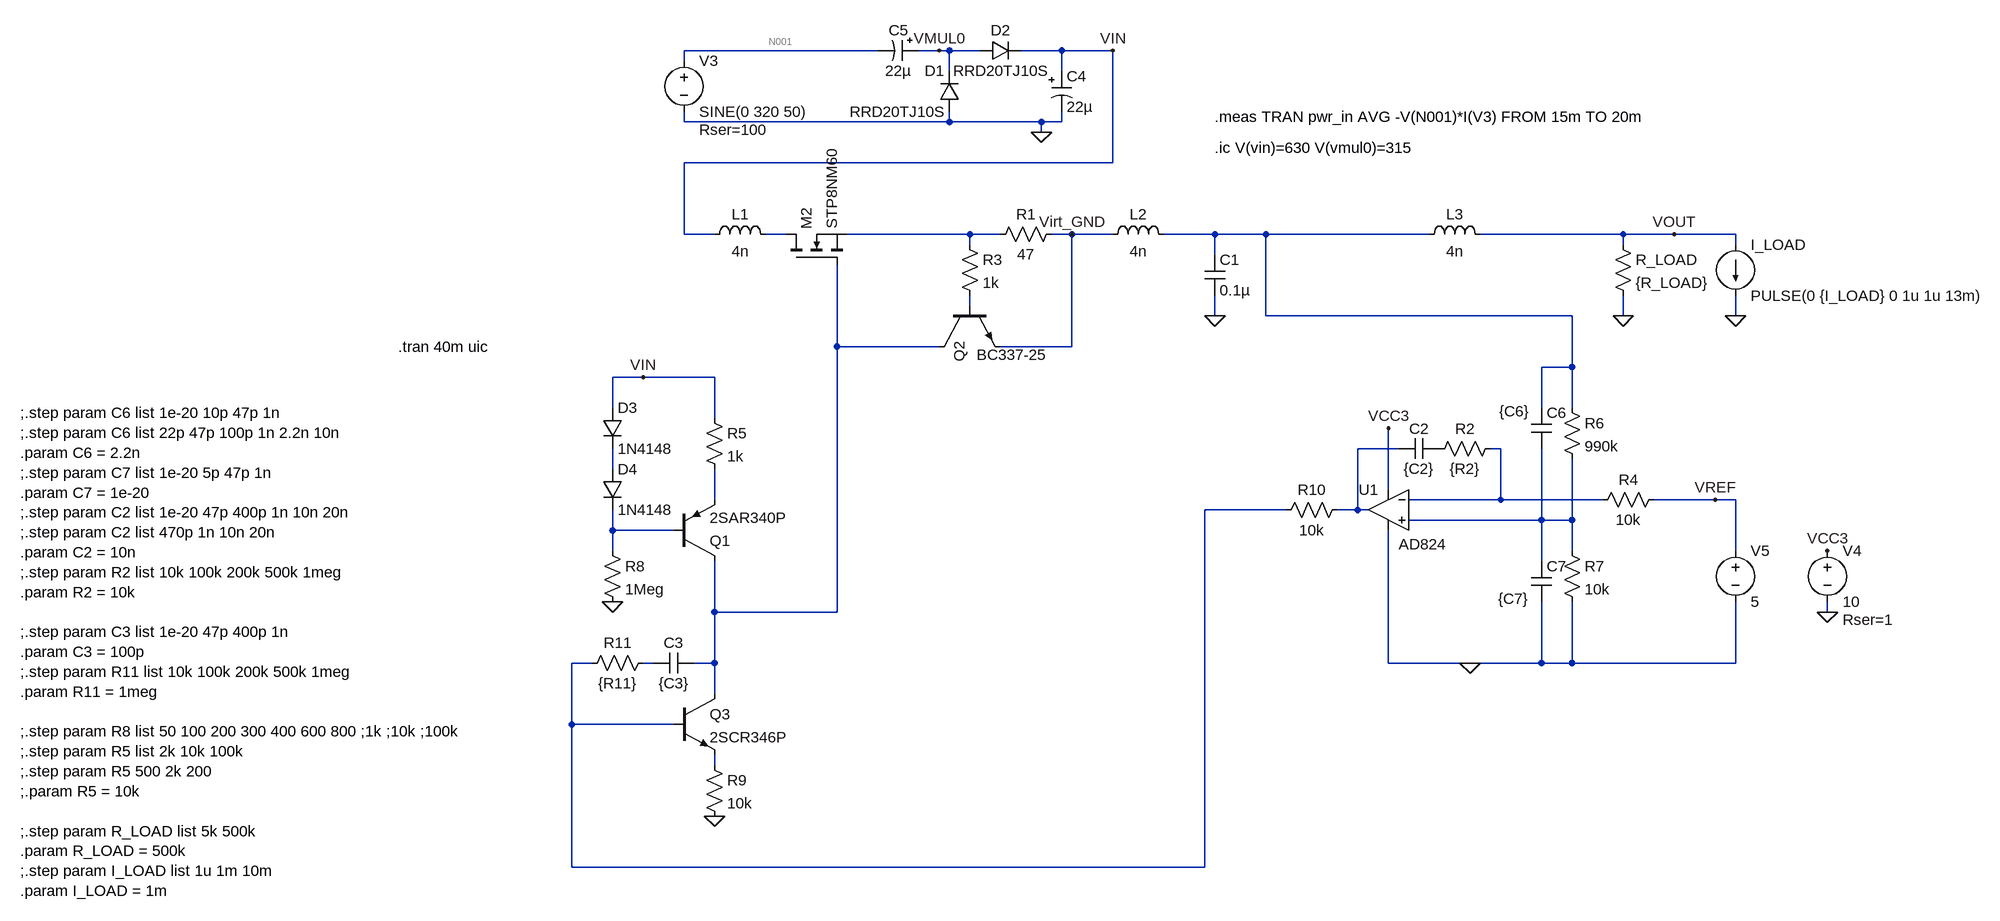
[diagram p0: schematic high_voltage_power_supply_Tim2.asc]
high_voltage_power_supply_Tim2.asc, the LTspice schematic file:
Version 4
SHEET 1 2392 1152
WIRE 464 -288 160 -288
WIRE 560 -288 528 -288
WIRE 576 -288 560 -288
WIRE 624 -288 576 -288
WIRE 752 -288 688 -288
WIRE 832 -288 752 -288
WIRE 160 -272 160 -288
WIRE 576 -256 576 -288
WIRE 752 -256 752 -288
WIRE 160 -176 160 -192
WIRE 576 -176 576 -192
WIRE 576 -176 160 -176
WIRE 720 -176 576 -176
WIRE 752 -176 752 -192
WIRE 752 -176 720 -176
WIRE 720 -160 720 -176
WIRE 832 -112 832 -288
WIRE 832 -112 160 -112
WIRE 160 0 160 -112
WIRE 208 0 160 0
WIRE 320 0 288 0
WIRE 608 0 416 0
WIRE 656 0 608 0
WIRE 768 0 736 0
WIRE 832 0 768 0
WIRE 992 0 912 0
WIRE 1072 0 992 0
WIRE 1328 0 1072 0
WIRE 1632 0 1408 0
WIRE 1712 0 1632 0
WIRE 1808 0 1712 0
WIRE 608 16 608 0
WIRE 1632 16 1632 0
WIRE 1808 16 1808 0
WIRE 992 32 992 0
WIRE 608 112 608 96
WIRE 992 128 992 96
WIRE 1072 128 1072 0
WIRE 1552 128 1072 128
WIRE 1632 128 1632 96
WIRE 1808 128 1808 96
WIRE 400 176 400 48
WIRE 560 176 400 176
WIRE 768 176 768 0
WIRE 768 176 656 176
WIRE 1552 208 1552 128
WIRE 1552 208 1504 208
WIRE 96 224 48 224
WIRE 208 224 96 224
WIRE 48 272 48 224
WIRE 1504 272 1504 208
WIRE 1552 272 1552 208
WIRE 208 288 208 224
WIRE 1280 336 1216 336
WIRE 1440 336 1424 336
WIRE 48 368 48 336
WIRE 1264 400 1264 304
WIRE 208 416 208 368
WIRE 1440 416 1440 336
WIRE 1440 416 1296 416
WIRE 1600 416 1440 416
WIRE 1776 416 1680 416
WIRE 1808 416 1776 416
WIRE 1104 432 976 432
WIRE 1216 432 1216 336
WIRE 1216 432 1184 432
WIRE 1232 432 1216 432
WIRE 1504 448 1504 336
WIRE 1504 448 1296 448
WIRE 1552 448 1552 352
WIRE 1552 448 1504 448
WIRE 48 464 48 432
WIRE 144 464 48 464
WIRE 48 496 48 464
WIRE 1552 496 1552 448
WIRE 1808 496 1808 416
WIRE 1504 512 1504 448
WIRE 208 592 208 512
WIRE 400 592 400 176
WIRE 400 592 208 592
WIRE 1952 592 1952 576
WIRE 16 672 -16 672
WIRE 112 672 96 672
WIRE 208 672 208 592
WIRE 208 672 176 672
WIRE 1264 672 1264 464
WIRE 1392 672 1264 672
WIRE 1504 672 1504 576
WIRE 1504 672 1392 672
WIRE 1552 672 1552 576
WIRE 1552 672 1504 672
WIRE 1808 672 1808 576
WIRE 1808 672 1552 672
WIRE 208 720 208 672
WIRE -16 768 -16 672
WIRE 144 768 -16 768
WIRE 208 832 208 816
WIRE -16 992 -16 768
WIRE 976 992 976 432
WIRE 976 992 -16 992
FLAG 992 128 0
FLAG 1632 128 0
FLAG 1712 0 VOUT
FLAG 1952 592 0
FLAG 1776 416 VREF
FLAG 720 -160 0
FLAG 832 -288 VIN
FLAG 1952 496 VCC3
FLAG 1264 304 VCC3
FLAG 1808 128 0
FLAG 1392 672 0
FLAG 560 -288 VMUL0
FLAG 768 0 Virt_GND
FLAG 96 224 VIN
FLAG 48 576 0
FLAG 208 912 0
SYMBOL npn 560 112 M90
WINDOW 3 77 59 VRight 2
SYMATTR Value BC337-25
SYMATTR InstName Q2
SYMBOL res 640 16 R270
WINDOW 0 32 56 VTop 2
WINDOW 3 0 56 VBottom 2
SYMATTR InstName R1
SYMATTR Value 47
SYMBOL cap 976 32 R0
SYMATTR InstName C1
SYMATTR Value 0.1µ
SYMATTR SpiceLine V=1K Irms=0 Rser=0.0493 Lser=9.64n mfg="Würth Elektronik" pn="890493425009CS WCAP-FTBE 15 x 18 x 15 x 8.5" type="Box"
SYMBOL res 1616 0 R0
SYMATTR InstName R_LOAD
SYMATTR Value {R_LOAD}
SYMBOL voltage 1952 480 R0
WINDOW 123 0 0 Left 0
WINDOW 39 24 124 Left 2
SYMATTR SpiceLine Rser=1
SYMATTR InstName V4
SYMATTR Value 10
SYMBOL res 1536 256 R0
SYMATTR InstName R6
SYMATTR Value 990k
SYMBOL res 1536 480 R0
SYMATTR InstName R7
SYMATTR Value 10k
SYMBOL cap 1344 320 R90
WINDOW 0 0 32 VBottom 2
WINDOW 3 32 32 VTop 2
SYMATTR InstName C2
SYMATTR Value {C2}
SYMATTR SpiceLine V=25 Irms=533m Rser=0.222978 Lser=0
SYMBOL voltage 1808 480 R0
WINDOW 123 0 0 Left 0
WINDOW 39 0 0 Left 0
SYMATTR InstName V5
SYMATTR Value 5
SYMBOL OpAmps\\AD824 1264 368 M0
WINDOW 3 -90 118 Left 2
SYMATTR InstName U1
SYMBOL ind 192 16 R270
WINDOW 0 32 56 VTop 2
WINDOW 3 5 56 VBottom 2
SYMATTR InstName L1
SYMATTR Value 4n
SYMBOL ind 816 16 R270
WINDOW 0 32 56 VTop 2
WINDOW 3 5 56 VBottom 2
SYMATTR InstName L2
SYMATTR Value 4n
SYMBOL voltage 160 -288 R0
WINDOW 123 0 0 Left 0
WINDOW 39 24 124 Left 2
SYMATTR SpiceLine Rser=100
SYMATTR InstName V3
SYMATTR Value SINE(0 320 50)
SYMBOL polcap 736 -256 R0
WINDOW 3 24 56 Left 2
SYMATTR Value 22µ
SYMATTR InstName C4
SYMATTR Description Capacitor
SYMATTR Type cap
SYMATTR SpiceLine V=400 Irms=162m Rser=0.4083 Lser=4.41n mfg="Würth Elektronik" pn="860021375012 WCAP-ATG5 10x25" type="Al electrolytic"
SYMBOL polcap 528 -304 R90
WINDOW 0 0 32 VBottom 2
WINDOW 3 32 32 VTop 2
SYMATTR InstName C5
SYMATTR Value 22µ
SYMATTR Description Capacitor
SYMATTR Type cap
SYMATTR SpiceLine V=400 Irms=557m Rser=0.5269 Lser=7.55n mfg="Würth Elektronik" pn="860241378003 WCAP-AT1H 13x20" type="Al electrolytic"
SYMBOL diode 592 -192 R180
WINDOW 0 24 64 Left 2
WINDOW 3 24 0 Left 2
SYMATTR InstName D1
SYMATTR Value RRD20TJ10S
SYMBOL diode 624 -272 R270
WINDOW 0 32 32 VTop 2
WINDOW 3 0 32 VBottom 2
SYMATTR InstName D2
SYMATTR Value RRD20TJ10S
SYMBOL cap 1488 272 R0
WINDOW 3 -50 5 Left 2
SYMATTR Value {C6}
SYMATTR InstName C6
SYMATTR SpiceLine V=1K Irms=0 Rser=0.1 Lser=0
SYMBOL current 1808 16 R0
WINDOW 123 0 0 Left 0
WINDOW 39 0 0 Left 0
SYMATTR InstName I_LOAD
SYMATTR Value PULSE(0 {I_LOAD} 0 1u 1u 13m)
SYMBOL nmos 320 48 R270
SYMATTR InstName M2
SYMATTR Value STP8NM60
SYMBOL cap 1488 512 R0
WINDOW 3 -52 59 Left 2
SYMATTR Value {C7}
SYMATTR InstName C7
SYMBOL res 1696 400 R90
WINDOW 0 0 56 VBottom 2
WINDOW 3 32 56 VTop 2
SYMATTR InstName R4
SYMATTR Value 10k
SYMBOL res 1200 416 R90
WINDOW 0 0 56 VBottom 2
WINDOW 3 32 56 VTop 2
SYMATTR InstName R10
SYMATTR Value 10k
SYMBOL res 1440 320 R90
WINDOW 0 0 56 VBottom 2
WINDOW 3 32 56 VTop 2
SYMATTR InstName R2
SYMATTR Value {R2}
SYMBOL res 592 0 R0
SYMATTR InstName R3
SYMATTR Value 1k
SYMBOL diode 32 272 R0
SYMATTR InstName D3
SYMATTR Value 1N4148
SYMBOL diode 32 368 R0
SYMATTR InstName D4
SYMATTR Value 1N4148
SYMBOL res 192 272 R0
SYMATTR InstName R5
SYMATTR Value 1k
SYMBOL pnp 144 512 M180
SYMATTR InstName Q1
SYMATTR Value 2SAR340P
SYMBOL res 32 480 R0
SYMATTR InstName R8
SYMATTR Value 1Meg
SYMBOL npn 144 720 R0
SYMATTR InstName Q3
SYMATTR Value 2SCR346P
SYMBOL res 192 816 R0
SYMATTR InstName R9
SYMATTR Value 10k
SYMBOL cap 176 656 R90
WINDOW 0 0 32 VBottom 2
WINDOW 3 32 32 VTop 2
SYMATTR InstName C3
SYMATTR Value {C3}
SYMBOL res 112 656 R90
WINDOW 0 0 56 VBottom 2
WINDOW 3 32 56 VTop 2
SYMATTR InstName R11
SYMATTR Value {R11}
SYMBOL ind 1312 16 R270
WINDOW 0 32 56 VTop 2
WINDOW 3 5 56 VBottom 2
SYMATTR InstName L3
SYMATTR Value 4n
TEXT -288 176 Left 2 !.tran 40m uic
TEXT -880 280 Left 2 !;.step param C6 list 1e-20 10p 47p 1n\n;.step param C6 list 22p 47p 100p 1n 2.2n 10n\n.param C6 = 2.2n\n;.step param C7 list 1e-20 5p 47p 1n\n.param C7 = 1e-20\n;.step param C2 list 1e-20 47p 400p 1n 10n 20n\n;.step param C2 list 470p 1n 10n 20n\n.param C2 = 10n\n;.step param R2 list 10k 100k 200k 500k 1meg\n.param R2 = 10k\n \n;.step param C3 list 1e-20 47p 400p 1n\n.param C3 = 100p\n;.step param R11 list 10k 100k 200k 500k 1meg\n.param R11 = 1meg\n \n;.step param R8 list 50 100 200 300 400 600 800 ;1k ;10k ;100k\n;.step param R5 list 2k 10k 100k\n;.step param R5 500 2k 200\n;.param R5 = 10k\n \n;.step param R_LOAD list 5k 500k\n.param R_LOAD = 500k\n;.step param I_LOAD list 1u 1m 10m\n.param I_LOAD = 1m
TEXT 992 -184 Left 2 !.meas TRAN pwr_in AVG -V(N001)*I(V3) FROM 15m TO 20m
TEXT 992 -136 Left 2 !.ic V(vin)=630 V(vmul0)=315

The netlist it stands for:
* high_voltage_power_supply_Tim2.asc
Q2 N006 N005 Virt_GND 0 BC337-25
R1 N003 Virt_GND 47
C1 N004 0 0.1µ V=1K Irms=0 Rser=0.0493 Lser=9.64n mfg="Würth Elektronik" pn="890493425009CS WCAP-FTBE 15 x 18 x 15 x 8.5" type="Box"
R_LOAD VOUT 0 {R_LOAD}
V4 VCC3 0 10 Rser=1
R6 N004 N012 990k
R7 N012 0 10k
C2 P001 N007 {C2} V=25 Irms=533m Rser=0.222978 Lser=0
V5 VREF 0 5
XU1 N012 N008 VCC3 0 N007 AD824  ; pins In+ In- V+ V- OUT
L1 VIN N002 4n
L2 Virt_GND N004 4n
V3 N001 0 SINE(0 320 50) Rser=100
C4 VIN 0 22µ V=400 Irms=162m Rser=0.4083 Lser=4.41n mfg="Würth Elektronik" pn="860021375012 WCAP-ATG5 10x25" type="Al electrolytic"
C5 VMUL0 N001 22µ V=400 Irms=557m Rser=0.5269 Lser=7.55n mfg="Würth Elektronik" pn="860241378003 WCAP-AT1H 13x20" type="Al electrolytic"
D1 0 VMUL0 RRD20TJ10S
D2 VMUL0 VIN RRD20TJ10S
C6 N004 N012 {C6} V=1K Irms=0 Rser=0.1 Lser=0
I_LOAD VOUT 0 PULSE(0 {I_LOAD} 0 1u 1u 13m)
M2 N002 N006 N003 N003 STP8NM60
C7 N012 0 {C7}
R4 VREF N008 10k
R10 N007 N011 10k
R2 N008 P001 {R2}
R3 N003 N005 1k
D3 VIN N009 1N4148
D4 N009 N013 1N4148
R5 VIN N010 1k
Q1 N006 N013 N010 0 2SAR340P
R8 N013 0 1Meg
Q3 N006 N011 N015 0 2SCR346P
R9 N015 0 10k
C3 N006 N014 {C3}
R11 N014 N011 {R11}
L3 N004 VOUT 4n
.model D D
.lib standard.dio
.model NPN NPN
.model PNP PNP
.lib standard.bjt
.model NMOS NMOS
.model PMOS PMOS
.lib standard.mos
.tran 40m uic
;.step param C6 list 1e-20 10p 47p 1n
;.step param C6 list 22p 47p 100p 1n 2.2n 10n
.param C6 = 2.2n
;.step param C7 list 1e-20 5p 47p 1n
.param C7 = 1e-20
;.step param C2 list 1e-20 47p 400p 1n 10n 20n
;.step param C2 list 470p 1n 10n 20n
.param C2 = 10n
;.step param R2 list 10k 100k 200k 500k 1meg
.param R2 = 10k
;.step param C3 list 1e-20 47p 400p 1n
.param C3 = 100p
;.step param R11 list 10k 100k 200k 500k 1meg
.param R11 = 1meg
;.step param R8 list 50 100 200 300 400 600 800 ;1k ;10k ;100k
;.step param R5 list 2k 10k 100k
;.step param R5 500 2k 200
;.param R5 = 10k
;.step param R_LOAD list 5k 500k
.param R_LOAD = 500k
;.step param I_LOAD list 1u 1m 10m
.param I_LOAD = 1m
.meas TRAN pwr_in AVG -V(N001)*I(V3) FROM 15m TO 20m
.ic V(vin)=630 V(vmul0)=315
.backanno
.end